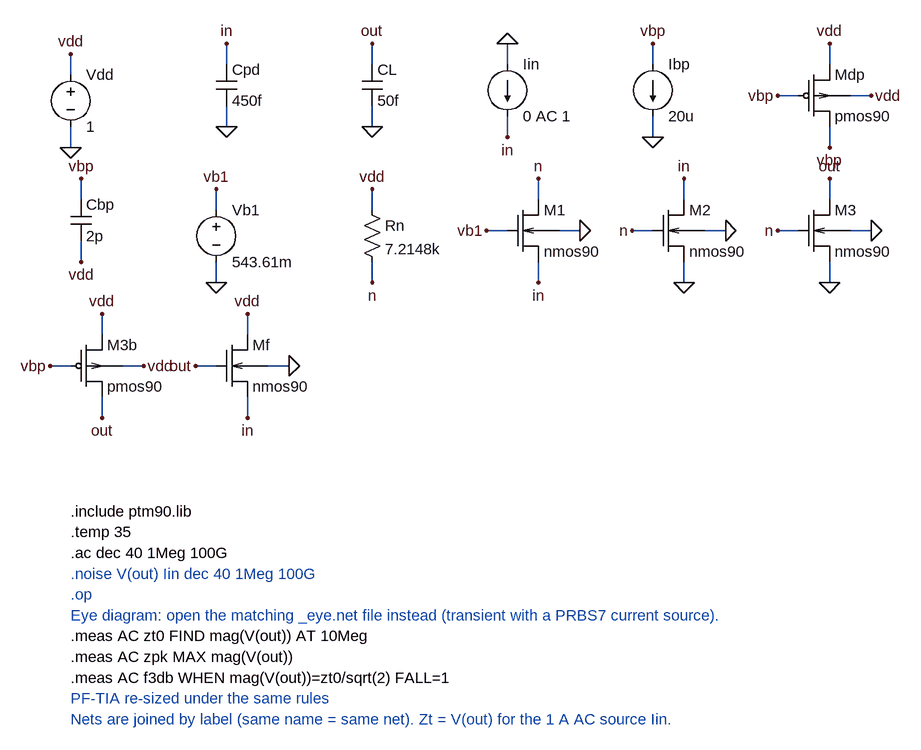
[diagram p0: schematic ref_pftia_earlier.asc]
ref_pftia_earlier.asc, the LTspice schematic file:
Version 4
SHEET 1 1600 1400
WIRE 0 16 0 -16
WIRE 0 96 0 128
WIRE 240 0 240 -32
WIRE 240 64 240 96
WIRE 464 0 464 -32
WIRE 464 64 464 96
WIRE 672 0 672 -32
WIRE 672 80 672 112
WIRE 896 0 896 -32
WIRE 896 80 896 112
WIRE 1168 96 1168 128
WIRE 1120 48 1088 48
WIRE 1168 0 1168 -32
WIRE 1200 48 1232 48
WIRE 16 208 16 176
WIRE 16 272 16 304
WIRE 224 224 224 192
WIRE 224 304 224 336
WIRE 464 224 464 192
WIRE 464 304 464 336
WIRE 720 208 720 176
WIRE 672 256 640 256
WIRE 720 304 720 336
WIRE 752 256 784 256
WIRE 944 208 944 176
WIRE 896 256 864 256
WIRE 944 304 944 336
WIRE 976 256 1008 256
WIRE 1168 208 1168 176
WIRE 1120 256 1088 256
WIRE 1168 304 1168 336
WIRE 1200 256 1232 256
WIRE 48 512 48 544
WIRE 0 464 -32 464
WIRE 48 416 48 384
WIRE 80 464 112 464
WIRE 272 416 272 384
WIRE 224 464 192 464
WIRE 272 512 272 544
WIRE 304 464 336 464
FLAG 0 -16 vdd
FLAG 0 128 0
FLAG 240 -32 in
FLAG 240 96 0
FLAG 464 -32 out
FLAG 464 96 0
FLAG 672 -32 0
FLAG 672 112 in
FLAG 896 -32 vbp
FLAG 896 112 0
FLAG 1168 128 vbp
FLAG 1088 48 vbp
FLAG 1168 -32 vdd
FLAG 1232 48 vdd
FLAG 16 176 vbp
FLAG 16 304 vdd
FLAG 224 192 vb1
FLAG 224 336 0
FLAG 464 192 vdd
FLAG 464 336 n
FLAG 720 176 n
FLAG 640 256 vb1
FLAG 720 336 in
FLAG 784 256 0
FLAG 944 176 in
FLAG 864 256 n
FLAG 944 336 0
FLAG 1008 256 0
FLAG 1168 176 out
FLAG 1088 256 n
FLAG 1168 336 0
FLAG 1232 256 0
FLAG 48 544 out
FLAG -32 464 vbp
FLAG 48 384 vdd
FLAG 112 464 vdd
FLAG 272 384 vdd
FLAG 192 464 out
FLAG 272 544 in
FLAG 336 464 0
SYMBOL voltage 0 0 R0
SYMATTR InstName Vdd
SYMATTR Value 1
SYMBOL cap 224 0 R0
SYMATTR InstName Cpd
SYMATTR Value 450f
SYMBOL cap 448 0 R0
SYMATTR InstName CL
SYMATTR Value 50f
SYMBOL current 672 0 R0
SYMATTR InstName Iin
SYMATTR Value 0 AC 1
SYMBOL current 896 0 R0
SYMATTR InstName Ibp
SYMATTR Value 20u
SYMBOL tia_pmos4 1120 0 R0
SYMATTR InstName Mdp
SYMATTR Value pmos90
SYMATTR Value2 l=200n w=2u ad=0.4p as=0.4p pd=4.4u ps=4.4u
SYMBOL cap 0 208 R0
SYMATTR InstName Cbp
SYMATTR Value 2p
SYMBOL voltage 224 208 R0
SYMATTR InstName Vb1
SYMATTR Value 543.61m
SYMBOL res 448 208 R0
SYMATTR InstName Rn
SYMATTR Value 7.2148k
SYMBOL tia_nmos4 672 208 R0
SYMATTR InstName M1
SYMATTR Value nmos90
SYMATTR Value2 l=100n w=3.618u ad=0.7236p as=0.7236p pd=7.636u ps=7.636u
SYMBOL tia_nmos4 896 208 R0
SYMATTR InstName M2
SYMATTR Value nmos90
SYMATTR Value2 l=100n w=2.682u ad=0.5363p as=0.5363p pd=5.763u ps=5.763u
SYMBOL tia_nmos4 1120 208 R0
SYMATTR InstName M3
SYMATTR Value nmos90
SYMATTR Value2 l=100n w=5.352u ad=1.07p as=1.07p pd=11.1u ps=11.1u
SYMBOL tia_pmos4 0 416 R0
SYMATTR InstName M3b
SYMATTR Value pmos90
SYMATTR Value2 l=200n w=27.28u ad=5.456p as=5.456p pd=54.96u ps=54.96u
SYMBOL tia_nmos4 224 416 R0
SYMATTR InstName Mf
SYMATTR Value nmos90
SYMATTR Value2 l=100n w=1.268u ad=0.2536p as=0.2536p pd=2.936u ps=2.936u
TEXT 0 688 Left 2 !.include ptm90.lib
TEXT 0 720 Left 2 !.temp 35
TEXT 0 752 Left 2 !.ac dec 40 1Meg 100G
TEXT 0 784 Left 2 ;.noise V(out) Iin dec 40 1Meg 100G
TEXT 0 816 Left 2 ;.op
TEXT 0 848 Left 2 ;Eye diagram: open the matching _eye.net file instead (transient with a PRBS7 current source).
TEXT 0 880 Left 2 !.meas AC zt0 FIND mag(V(out)) AT 10Meg
TEXT 0 912 Left 2 !.meas AC zpk MAX mag(V(out))
TEXT 0 944 Left 2 !.meas AC f3db WHEN mag(V(out))=zt0/sqrt(2) FALL=1
TEXT 0 976 Left 2 ;PF-TIA re-sized under the same rules
TEXT 0 1008 Left 2 ;Nets are joined by label (same name = same net). Zt = V(out) for the 1 A AC source Iin.

The netlist it stands for:
* ref_pftia_earlier.asc
Vdd vdd 0 1
Cpd in 0 450f
CL out 0 50f
Iin 0 in 0 AC 1
Ibp vbp 0 20u
Mdp vbp vbp vdd vdd pmos90 l=200n w=2u ad=0.4p as=0.4p pd=4.4u ps=4.4u
Cbp vbp vdd 2p
Vb1 vb1 0 543.61m
Rn vdd n 7.2148k
M1 n vb1 in 0 nmos90 l=100n w=3.618u ad=0.7236p as=0.7236p pd=7.636u ps=7.636u
M2 in n 0 0 nmos90 l=100n w=2.682u ad=0.5363p as=0.5363p pd=5.763u ps=5.763u
M3 out n 0 0 nmos90 l=100n w=5.352u ad=1.07p as=1.07p pd=11.1u ps=11.1u
M3b out vbp vdd vdd pmos90 l=200n w=27.28u ad=5.456p as=5.456p pd=54.96u ps=54.96u
Mf vdd out in 0 nmos90 l=100n w=1.268u ad=0.2536p as=0.2536p pd=2.936u ps=2.936u
.model NMOS NMOS
.model PMOS PMOS
.lib standard.mos
.include ptm90.lib
.temp 35
.ac dec 40 1Meg 100G
* .noise V(out) Iin dec 40 1Meg 100G
* .op
* Eye diagram: open the matching _eye.net file instead (transient with a PRBS7 current source).
.meas AC zt0 FIND mag(V(out)) AT 10Meg
.meas AC zpk MAX mag(V(out))
.meas AC f3db WHEN mag(V(out))=zt0/sqrt(2) FALL=1
* PF-TIA re-sized under the same rules
* Nets are joined by label (same name = same net). Zt = V(out) for the 1 A AC source Iin.
.backanno
.end